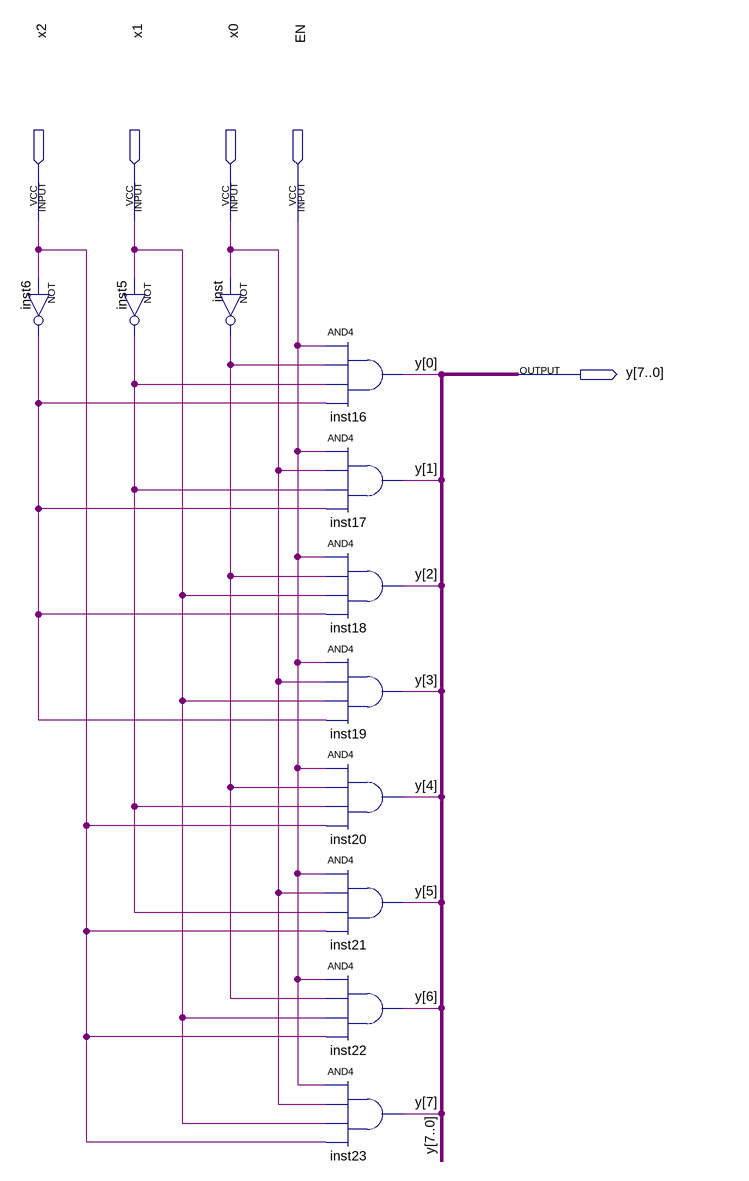
[diagram p0: schematic sheet]
// Quartus schematic 8DC_bus.bdf as structural Verilog: 11 symbols, 5 pins
module \8DC_bus  (
  input  x2,
  input  x1,
  input  x0,
  input  EN,
  output [7:0] y
);

  wire inst5_out, inst6_out, inst_out;

  not inst6 (inst6_out, x2);
  not inst5 (inst5_out, x1);
  not inst (inst_out, x0);
  and inst16 (y[0], EN, inst_out, inst5_out, inst6_out);
  and inst17 (y[1], EN, x0, inst5_out, inst6_out);
  and inst18 (y[2], EN, inst_out, x1, inst6_out);
  and inst19 (y[3], EN, x0, x1, inst6_out);
  and inst20 (y[4], EN, inst_out, inst5_out, x2);
  and inst21 (y[5], EN, x0, inst5_out, x2);
  and inst22 (y[6], EN, inst_out, x1, x2);
  and inst23 (y[7], EN, x0, x1, x2);
endmodule
